# Altium schematic sheet Power_ADP1850_Dual.SchDoc: Power_ADP1850_Dual (part 3 of 3)
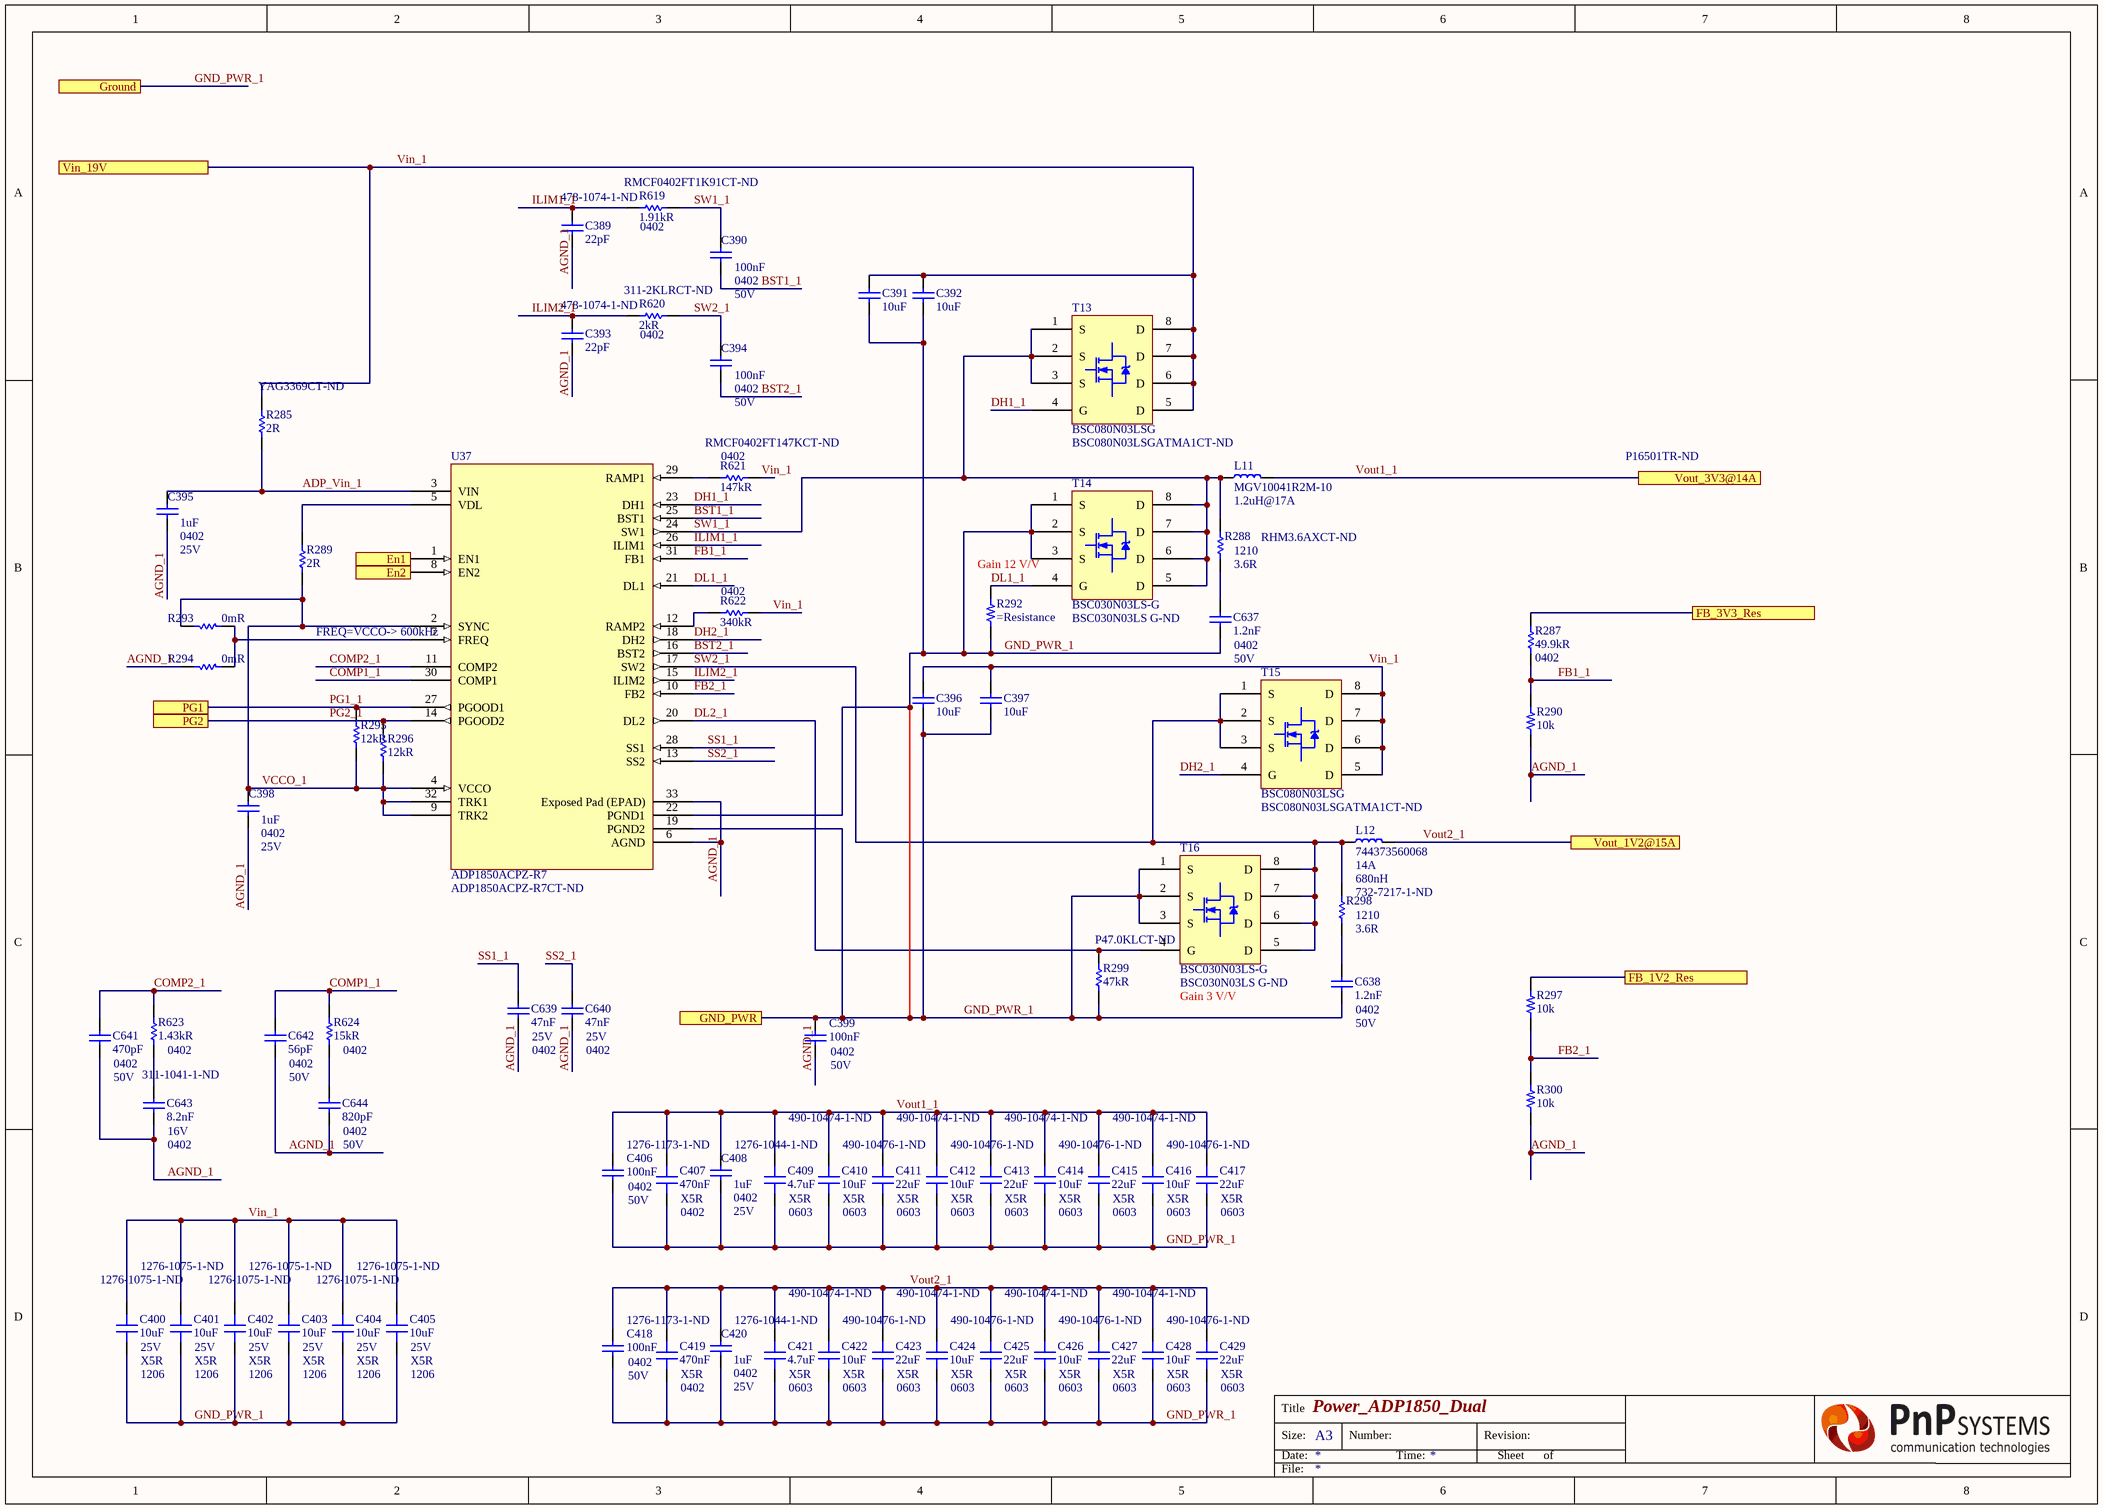
[diagram p2: Power_ADP1850_Dual.SchDoc]

## Library data of the parts (continued)
R624 = Resistor: Manufacturer: Panasonic; Manufacturer Part Number: ERJ-2RKF1502X; Tolerance: 1%; Voltage Rating: 50V; Power Rating: 100mW; Temperature Coefficient: 100ppm/°C; Supplier 1: Digi-Key; Supplier Part Number 1: P15.0KLDKR-ND; Stock 1: 3339464; Pricing 1: 1 = 0,10000, 10 = 0,04100, 100 = 0,01670, 1000 = 0,00751, 2500 = 0,00652, 5000 = 0,00538 (USD); RoHS: Yes; Mount: Surface Mount; Case/Package: 0402; Number of Pins: 2; Weight: 2.8E-05oz; Case Code (Metric): 1005; Contact Plating: Tin; Min Operating Temperature: -55°C; Max Operating Temperature: 155°C; Resistance: 15kR; Packaging: Tape and Reel; Package Quantity: 1; Composition: Thick Film; Termination: SMD/SMT; Number of Terminations: 2; Military Standard: Not; Max Power Dissipation: 100mW; Voltage Rating (DC): 50V; Features: Automotive AEC-Q200; Length: 1mm; Height: 0.35mm; Width: 0.5mm; Depth: 0.5mm; Radiation Hardening: No; REACH SVHC: No SVHC; Lead Free: Lead Free; ComponentLink1URL: https://datasheet.ciiva.com/11821/0900766b80f80784-11821181.pdf?src-supplier=RSComponents; ComponentLink1Description: https://datasheet.ciiva.com/11821/0900766b80f80784-11821181.pdf?src-supplier=RSComponents; ComponentLink2URL: https://datasheet.ciiva.com/16778/70260748-16778682.pdf?src-supplier=Allied+Electronics; ComponentLink2Description: https://datasheet.ciiva.com/16778/70260748-16778682.pdf?src-supplier=Allied+Electronics; ComponentLink3URL: https://datasheet.ciiva.com/46372/1678782-46372862.pdf?src-supplier=Element14; ComponentLink3Description: https://datasheet.ciiva.com/46372/1678782-46372862.pdf?src-supplier=Element14; ComponentLink4URL: https://datasheet.ciiva.com/17211/aoa0000ce2-17211535.pdf?src-supplier=Avnet+Europe; ComponentLink4Description: https://datasheet.ciiva.com/17211/aoa0000ce2-17211535.pdf?src-supplier=Avnet+Europe; ComponentLink5URL: https://datasheet.ciiva.com/46372/1678782-46372863.pdf?src-supplier=Element14; ComponentLink5Description: https://datasheet.ciiva.com/46372/1678782-46372863.pdf?src-supplier=Element14; ComponentLink6URL: https://datasheet.ciiva.com/6138/aoa0000ce2-6138166.pdf?src-supplier=Farnell; ComponentLink6Description: https://datasheet.ciiva.com/6138/aoa0000ce2-6138166.pdf?src-supplier=Farnell; ComponentLink7URL: https://datasheet.ciiva.com/16765/70260748-16765542.pdf?src-supplier=Allied+Electronics; ComponentLink7Description: https://datasheet.ciiva.com/16765/70260748-16765542.pdf?src-supplier=Allied+Electronics; ComponentLink8URL: https://datasheet.ciiva.com/43467/1678782-43467414.pdf?src-supplier=Farnell; ComponentLink8Description: https://datasheet.ciiva.com/43467/1678782-43467414.pdf?src-supplier=Farnell; ComponentLink9URL: https://datasheet.ciiva.com/9193/aoa0000ce2-9193047.pdf?src-supplier=Avnet; ComponentLink9Description: https://datasheet.ciiva.com/9193/aoa0000ce2-9193047.pdf?src-supplier=Avnet; ComponentLink10URL: https://datasheet.ciiva.com/8079/426256-8079609.pdf?src-supplier=Element14; ComponentLink10Description: https://datasheet.ciiva.com/8079/426256-8079609.pdf?src-supplier=Element14; ComponentLink11URL: https://datasheet.ciiva.com/16371/aoa0000ce2-16371499.pdf?src-supplier=Future+Electronics; ComponentLink11Description: https://datasheet.ciiva.com/16371/aoa0000ce2-16371499.pdf?src-supplier=Future+Electronics; ComponentLink12URL: https://datasheet.ciiva.com/22687/1678782-22687068.pdf?src-supplier=Element14; ComponentLink12Description: https://datasheet.ciiva.com/22687/1678782-22687068.pdf?src-supplier=Element14
T13 T15 = BSC080N03LSG: MOSFET N-CH 30V 53A TDSON-8; Manufacturer 1: Infineon; Rds On Max: 8mR; Input Capacitance: 1.7nF; Rise Time: 2.8ns; Max Power Dissipation: 35W; Power Dissipation: 2.5W; Gate to Source Voltage (Vgs): 20V; Fall Time: 2.6ns; Turn-Off Delay Time: 15ns; Threshold Voltage: 2.2V; Turn-On Delay Time: 3.3ns; Element Configuration: Single; Supplier 1: Digi-Key; Manufacturer Part Number 1: BSC080N03LSG; Stock 1: 16105; Pricing 1: 1=0,70000, 10=0,61600, 100=0,42020, 500=0,35108, 1000=0,29878 (USD); RoHS: Yes; Number of Pins: 8; Min Operating Temperature: -55°C; Max Operating Temperature: 150°C; Packaging: Tape and Reel; Drain to Source Voltage (Vdss): 30V; Continuous Drain Current (ID): 53A; Package Quantity: 1; Drain to Source Breakdown Voltage: 30V; Drain to Source Resistance: 8mR; Length: 6.35mm; Height: 1.1mm; Width: 5.35mm; Halogen Free: Halogen Free; REACH SVHC: No SVHC; ComponentLink1URL: https://datasheet.ciiva.com/1189/infineon-bsc080n03ls-ds-v02-01-en-1189645.pdf?src-supplier=Element14; ComponentLink1Description: https://datasheet.ciiva.com/1189/infineon-bsc080n03ls-ds-v02-01-en-1189645.pdf?src-supplier=Element14; ComponentLink2URL: https://datasheet.ciiva.com/26789/bsc080n03ls-g-26789476.pdf?src-supplier=IIIC; ComponentLink2Description: https://datasheet.ciiva.com/26789/bsc080n03ls-g-26789476.pdf?src-supplier=IIIC
T14 T16 = BSC030N03LS-G: MOSFET, N CH, 100A, 30V, PG-TDSON-8; Manufacturer 1: Infineon; Rise Time: 5.2ns; Rds On Max: 3mR; Input Capacitance: 4.3nF; Fall Time: 4.8ns; Power Dissipation: 2.5W; Turn-Off Delay Time: 29ns; Max Power Dissipation: 69W; Turn-On Delay Time: 7.3ns; Number of Elements: 1; Gate to Source Voltage (Vgs): 20V; Threshold Voltage: 1V; Drain to Source Resistance: 4.7mR; Element Configuration: Single; RoHS: Yes; Case/Package: TO-252-3; Number of Pins: 8; Contact Plating: Tin; Min Operating Temperature: -55°C; Max Operating Temperature: 150°C; Packaging: Tape and Reel; Continuous Drain Current (ID): 100A; Package Quantity: 5000; Drain to Source Breakdown Voltage: 30V; Length: 5.35mm; Height: 1.1mm; Width: 6.35mm; Radiation Hardening: No; Halogen Free: Halogen Free; Lead Free: Lead Free; REACH SVHC: No SVHC; ComponentLink1URL: https://datasheet.ciiva.com/26896/getdatasheetpartid-635090-26896521.pdf?src-supplier=Verical; ComponentLink1Description: https://datasheet.ciiva.com/26896/getdatasheetpartid-635090-26896521.pdf?src-supplier=Verical; ComponentLink2URL: https://datasheet.ciiva.com/26790/bsc030n03ls-g-26790009.pdf?src-supplier=IIIC; ComponentLink2Description: https://datasheet.ciiva.com/26790/bsc030n03ls-g-26790009.pdf?src-supplier=IIIC; ComponentLink3URL: https://datasheet.ciiva.com/6368/bsc030n03ls-rev1-27-6368951.pdf?src-supplier=Digi-Key; ComponentLink3Description: https://datasheet.ciiva.com/6368/bsc030n03ls-rev1-27-6368951.pdf?src-supplier=Digi-Key; ComponentLink4URL: https://datasheet.ciiva.com/6368/bsc030n03ls-rev1-27-6368952.pdf?src-supplier=Digi-Key; ComponentLink4Description: https://datasheet.ciiva.com/6368/bsc030n03ls-rev1-27-6368952.pdf?src-supplier=Digi-Key; ComponentLink5URL: https://datasheet.ciiva.com/11172/bsc030n03ls-rev1-27-11172568.pdf?src-supplier=Avnet; ComponentLink5Description: https://datasheet.ciiva.com/11172/bsc030n03ls-rev1-27-11172568.pdf?src-supplier=Avnet; ComponentLink6URL: https://datasheet.ciiva.com/11172/bsc030n03ls-rev1-27-11172569.pdf?src-supplier=Avnet; ComponentLink6Description: https://datasheet.ciiva.com/11172/bsc030n03ls-rev1-27-11172569.pdf?src-supplier=Avnet; ComponentLink7URL: https://datasheet.ciiva.com/6368/bsc030n03ls-rev1-27-6368954.pdf?src-supplier=Digi-Key; ComponentLink7Description: https://datasheet.ciiva.com/6368/bsc030n03ls-rev1-27-6368954.pdf?src-supplier=Digi-Key; Supplier 1: Digi-Key; Manufacturer Part Number 1: BSC030N03LS-G; Stock 1: 0
U37 = ADP1850ACPZ-R7: Analog Devices; Number of Outputs: 2; Output Voltage: 18V; Output Current: 25A; Max Supply Voltage: 20V; Min Supply Voltage: 2.75V; Switching Frequency: 1.5MHz; Max Duty Cycle: 90%; Synchronous Rectifier: Yes; Nominal Supply Current: 4.5mA; Max Output Current: 30A; Operating Supply Current: 100uA; Output Configuration: Positive; Supplier 1: Digi-Key; Manufacturer 1: Analog Devices; Manufacturer Part Number 1: ADP1850ACPZ-R7; Stock 1: 1022; Pricing 1: 1=4,61000, 10=4,14300, 25=3,91640, 100=3,39440, 250=3,22028, 500=2,88956 (USD); RoHS: Yes; Case/Package: LFCSP EP; Number of Pins: 32; Contact Plating: Tin,Matte; Min Operating Temperature: -40°C; Max Operating Temperature: 85°C; Packaging: Tape and Reel; Number of Output Phases: 2; Clock Sync: Yes; Max Input Voltage: 20V; Min Input Voltage: 2.75V; Radiation Hardening: No; REACH SVHC: No SVHC; Lead Free: Contains Lead; ComponentLink1URL: https://datasheet.ciiva.com/3217/adp1850-3217744.pdf?src-supplier=Avnet; ComponentLink1Description: https://datasheet.ciiva.com/3217/adp1850-3217744.pdf?src-supplier=Avnet; ComponentLink2URL: https://datasheet.ciiva.com/8306/adp1850-8306183.pdf?src-supplier=Avnet; ComponentLink2Description: https://datasheet.ciiva.com/8306/adp1850-8306183.pdf?src-supplier=Avnet; ComponentLink3URL: https://datasheet.ciiva.com/2015/adp1850-2015067.pdf?src-supplier=Digi-Key; ComponentLink3Description: https://datasheet.ciiva.com/2015/adp1850-2015067.pdf?src-supplier=Digi-Key; ComponentLink4URL: https://datasheet.ciiva.com/17297/adp1850-17297115.pdf?src-supplier=Avnet+Europe; ComponentLink4Description: https://datasheet.ciiva.com/17297/adp1850-17297115.pdf?src-supplier=Avnet+Europe; ComponentLink5URL: https://datasheet.ciiva.com/2015/adp1850-2015068.pdf?src-supplier=Digi-Key; ComponentLink5Description: https://datasheet.ciiva.com/2015/adp1850-2015068.pdf?src-supplier=Digi-Key; ComponentLink6URL: https://datasheet.ciiva.com/2015/adp1850-2015069.pdf?src-supplier=Digi-Key; ComponentLink6Description: https://datasheet.ciiva.com/2015/adp1850-2015069.pdf?src-supplier=Digi-Key